# Altium schematic sheet CW341_FPGA_USERIOA.SchDoc: <Enter Sheet Title>
size Letter; Organization: NewAE Technology Inc.; Address1: 1083 Queen St., Suite 196; Address2: Halifax; Address3: NS; Address4: Canada B3H 0B2; SheetNumber: 16; SheetTotal: 16; SheetApproved: YES
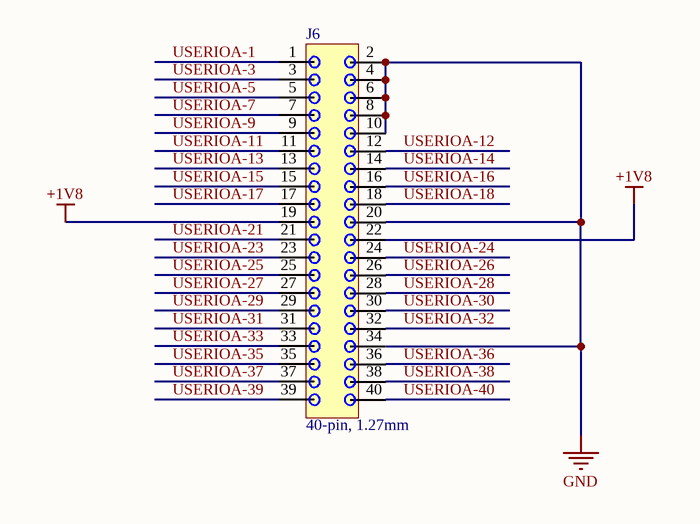
[diagram p0: CW341_FPGA_USERIOA.SchDoc]

## Parts
J6  40-pin, 1.27mm  [SHF-120-01-X-D-SM]

## Nets
+1V8: J6.19 J6.22
GND: J6.2 J6.4 J6.6 J6.8 J6.10 J6.20 J6.34
USERIOA-1: J6.1
USERIOA-3: J6.3
USERIOA-5: J6.5
USERIOA-7: J6.7
USERIOA-9: J6.9
USERIOA-11: J6.11
USERIOA-12: J6.12
USERIOA-13: J6.13
USERIOA-14: J6.14
USERIOA-15: J6.15
USERIOA-16: J6.16
USERIOA-17: J6.17
USERIOA-18: J6.18
USERIOA-21: J6.21
USERIOA-23: J6.23
USERIOA-24: J6.24
USERIOA-25: J6.25
USERIOA-26: J6.26
USERIOA-27: J6.27
USERIOA-28: J6.28
USERIOA-29: J6.29
USERIOA-30: J6.30
USERIOA-31: J6.31
USERIOA-32: J6.32
USERIOA-33: J6.33
USERIOA-35: J6.35
USERIOA-36: J6.36
USERIOA-37: J6.37
USERIOA-38: J6.38
USERIOA-39: J6.39
USERIOA-40: J6.40

## Notes on the sheet
- Title:
- Date:
- Rev:
- Time:
- Project:
- Sheet
- of
- License:
- Copyright © NewAE Technology Inc.
- Approved:
- NewAE.com
- File:

## Library data of the parts
J6 = CONN_40POS_1.27MM_SHROUDED: Manufacture 1: Samtec; Manufacture Part Number 1: SHF-120-01-L-D-SM; Component Group: Connector; PP Material Stack: 0; Part Number: CONN_40POS_1.27MM_SHROUDED; Pin Count: 40; Supplier 1: Digi-Key; Supplier Part Number 1: SAM9922-ND; Component Kind: Standard; Component Type: Standard; PP Rotation: 0; PP Rotation1: 0